# Altium schematic sheet Serial_Interface_UART.SchDoc
size A; DocumentNumber: 11; SheetNumber: 11; SheetTotal: 14
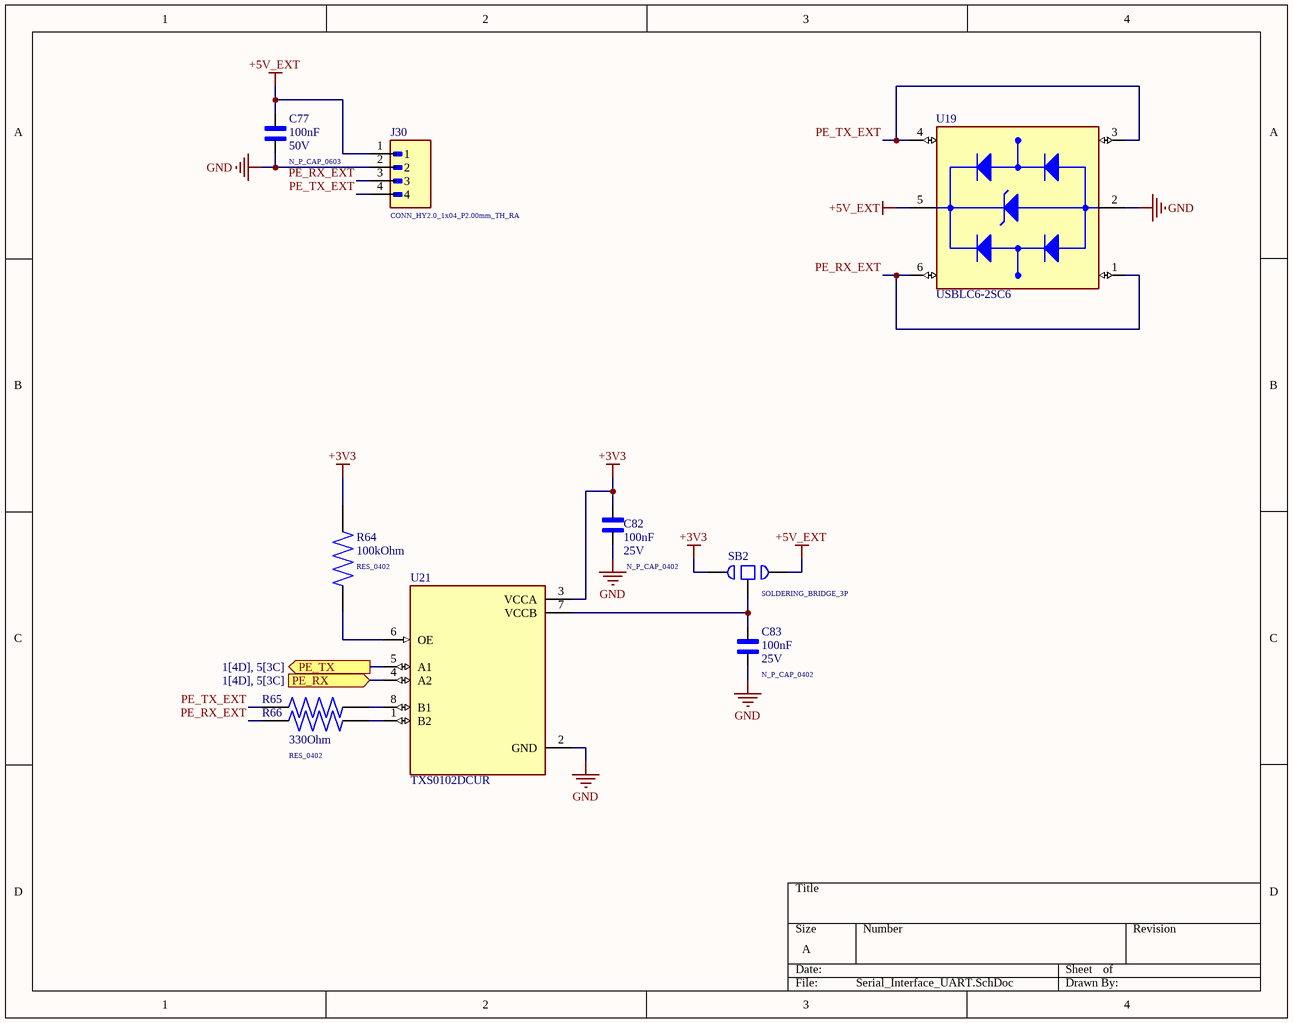
[diagram p0: Serial_Interface_UART.SchDoc]

## Parts
C77  N_P_CAP_0603  value 100nF  Rated Voltage: 50V  [N_P_CAP_0603]
C82  N_P_CAP_0402  value 100nF  Rated Voltage: 25V  [N_P_CAP_0402]
C83  N_P_CAP_0402  value 100nF  Rated Voltage: 25V  [N_P_CAP_0402]
J30  CONN_HY2.0_1x04_P2.00mm_TH_RA  [CONN_HY2.0_1x04_P2.00mm_TH_RA]
R64  RES_0402  value 100kOhm  [RES_0402]
R65  RES_0402  [RES_0402]  (value not drawn)
R66  RES_0402  value 330Ohm  [RES_0402]
SB2  SOLDERING_BRIDGE_3P  [SOLDERING_BRIDGE_3P]  (no BOM)
U19  USBLC6-2SC6  [SOT95P280X145-6N]
U21  TXS0102DCUR  [SOP50P310X90-8N]

## Ports
PE_RX (in, see 1[4D], 5[3C]), PE_TX (out, see 1[4D], 5[3C])

## Nets
+3V3: C82.2 R64.1 SB2.1 U21.3(VCCA)
+5V_EXT: C77.2 J30.1 SB2.2 U19.5(VBUS)
GND: C77.1 C82.1 C83.1 J30.2 U19.2(GND) U21.2(GND)
PE_RX: U21.4(A2) ; port PE_RX
PE_RX_EXT: J30.3 R66.2 U19.1(I/O1_IN) U19.6(I/O1_OUT)
PE_TX: U21.5(A1) ; port PE_TX
PE_TX_EXT: J30.4 R65.2 U19.3(I/O2_IN) U19.4(I/O2_OUT)
NetC83_2: C83.2 SB2.3 U21.7(VCCB)
NetR64_2: R64.2 U21.6(OE)
NetR65_1: R65.1 U21.8(B1)
NetR66_1: R66.1 U21.1(B2)

## Library data of the parts
C77 = N_P_CAP: GENERIC NON-POLARIZED CAP; LCSC Part Number: C106221; Tolerance: *; MF: *; ESR: *; MPN: *; Temperature Coefficient: *
C82 C83 = N_P_CAP: GENERIC NON-POLARIZED CAP; Temperature Coefficient: X7R; LCSC Part Number: C105883; Tolerance: *; MF: *; ESR: *; MPN: *
J30 = CONN_4P: GENERIC CONNECTOR 4P; MF: *; MPN: *; LCSC Part Number: C55381784
R64 = RES: GENERIC RES; Tolerance: 1%; Power Rating: *; MPN: *; Rated Voltage: *; Temperature Coefficient: *; LCSC Part Number: C60491
R65 = RES: GENERIC RES; MPN: RC0402FR-07330RL; Tolerance: 1%; Value: 330Ohm; Power Rating: *; Rated Voltage: *; Temperature Coefficient: *; LCSC Part Number: C105875
R66 = RES: GENERIC RES; MPN: RC0402FR-07330RL; Tolerance: 1%; Power Rating: *; Rated Voltage: *; Temperature Coefficient: *; LCSC Part Number: C105875
SB2 = SOLDERING_BRIDGE_3P: GENERIC SOLDERING BRIDGE 3P
U19 = USBLC6-2SC6: 17V Clamp 5A (8/20Âµs) Ipp Tvs Diode Surface Mount SOT-23-6; MF: STMicroelectronics; Package: SOT-23-6 STMicroelectronics; MPN: USBLC6-2SC6; LCSC Part Number: C7519
U21 = TXS0102DCUR: 2-Bit Bidirectional Voltage-Level Shifter for Open-Drain and Push-Pull Application; MF: Texas Instruments; Package: VSSOP-8 Texas Instruments; MPN: TXS0102DCUR